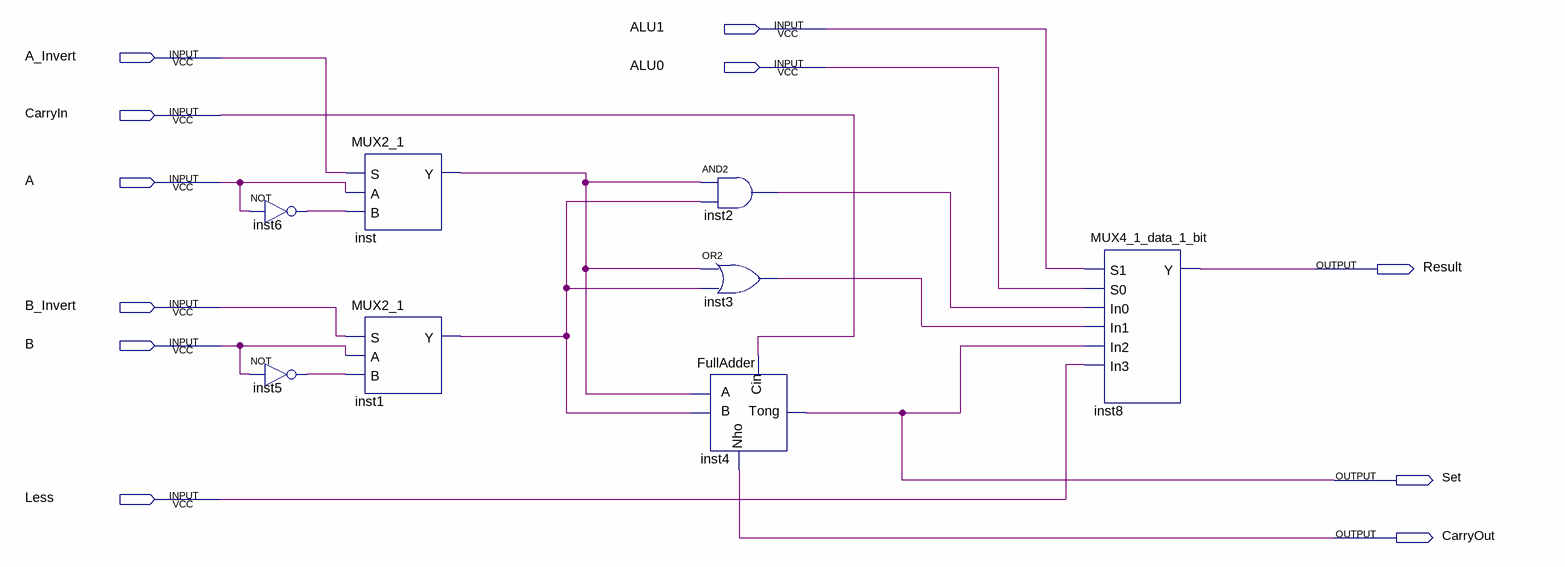
[diagram p0: schematic sheet]
// Quartus schematic ALU_cell.bdf as structural Verilog: 8 symbols, 11 pins
module ALU_cell (
  input  ALU1,
  input  A_Invert,
  input  ALU0,
  input  CarryIn,
  input  A,
  input  B_Invert,
  input  B,
  input  Less,
  output Result,
  output Set,
  output CarryOut
);

  wire inst1_y, inst2_out, inst3_out, inst5_out, inst6_out, inst_y;

  not inst6 (inst6_out, A);
  not inst5 (inst5_out, B);
  MUX2_1 inst (.S(A_Invert), .A(A), .B(inst6_out), .Y(inst_y));
  MUX2_1 inst1 (.S(B_Invert), .A(B), .B(inst5_out), .Y(inst1_y));
  and inst2 (inst2_out, inst_y, inst1_y);
  or inst3 (inst3_out, inst_y, inst1_y);
  FullAdder inst4 (.Cin(CarryIn), .A(inst_y), .B(inst1_y), .Tong(Set), .Nho(CarryOut));
  MUX4_1_data_1_bit inst8 (.S1(ALU1), .S0(ALU0), .In0(inst2_out), .In1(inst3_out), .In2(Set), .In3(Less), .Y(Result));
endmodule
